# Altium project Light_SPT_Device_v1.1.PrjPcb (part 2 of 4)

## Sheet Controller_Sheet.SchDoc
size 420 x 297 mm; SheetNumber: 3; SheetTotal: 4
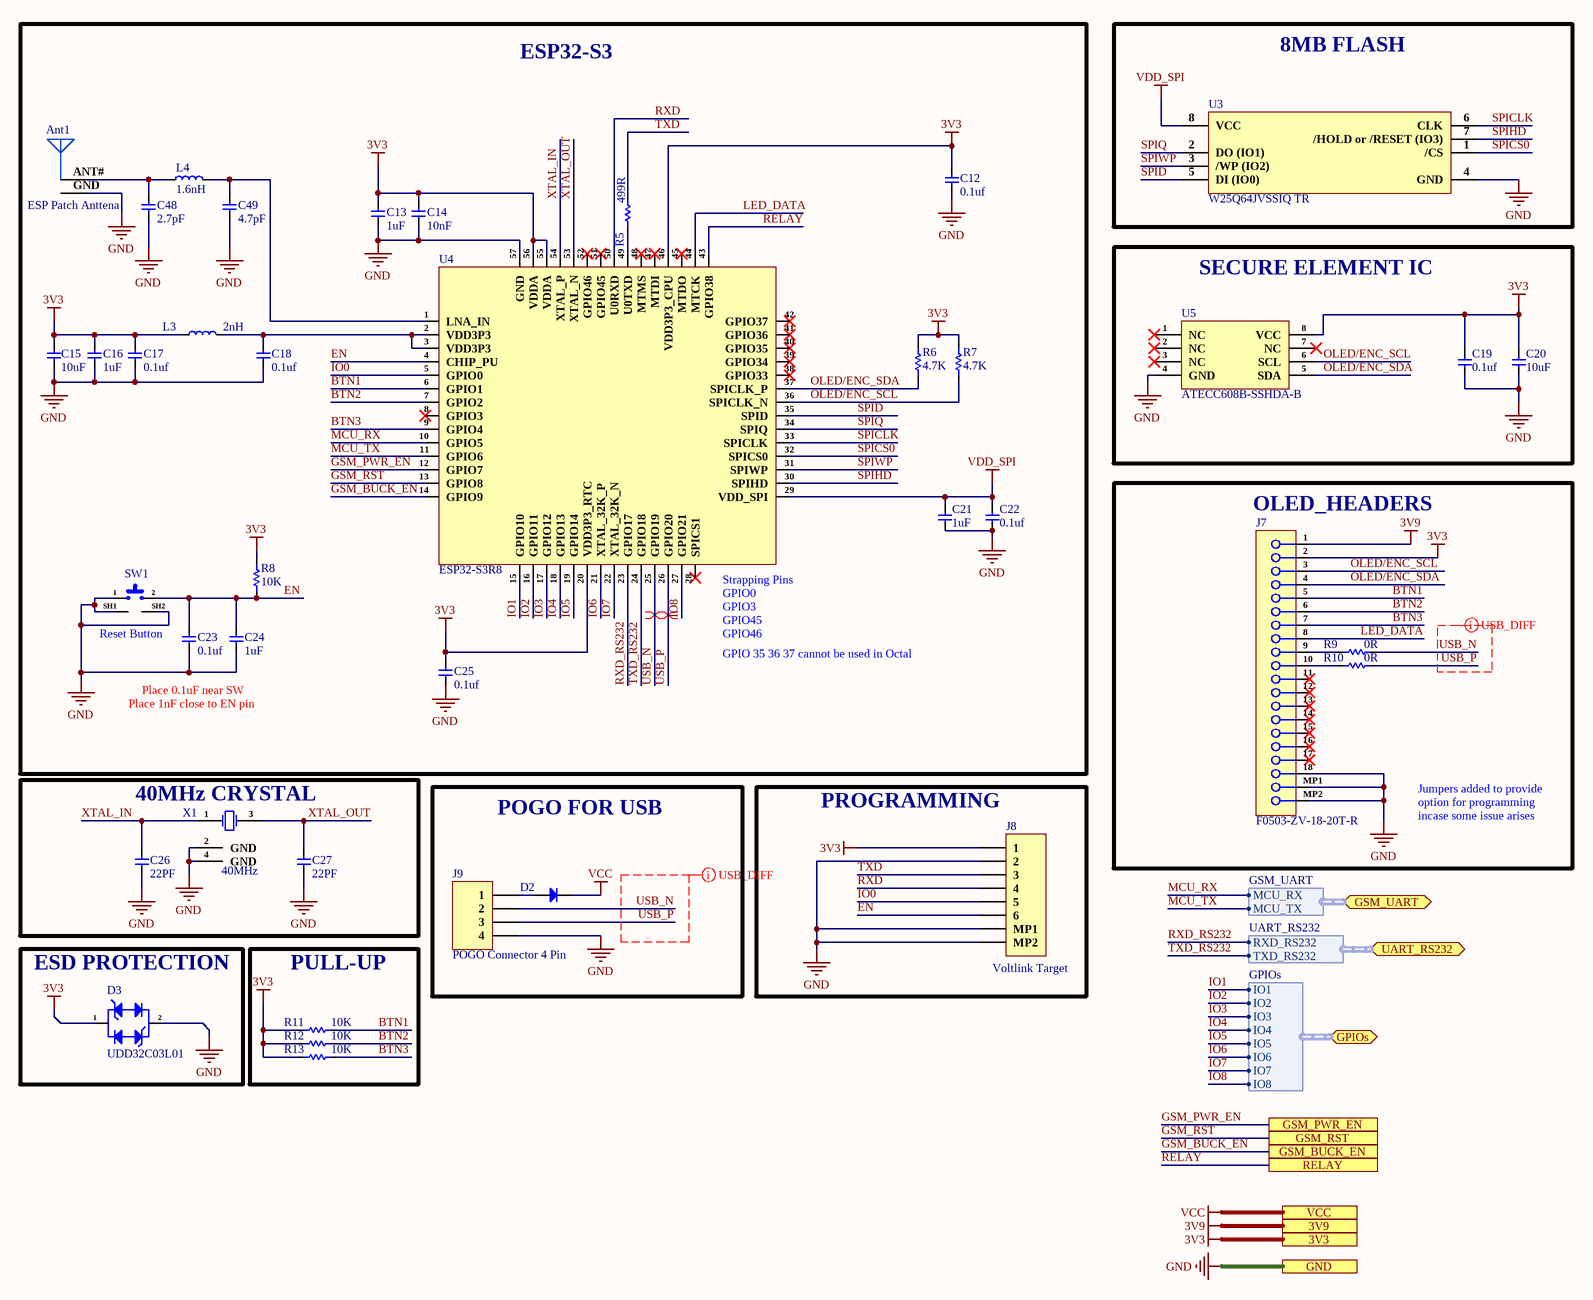
[diagram p2: Controller_Sheet.SchDoc]

### Parts
Ant1  ESP Patch Anttena  [ESP Patch Antenna]  (net tie, no BOM)
C12  0.1uf  [Cap-0402]
C13  1uF  [Cap-0402]
C14  10nF  [Cap-0402]
C15  10uF  [Cap-0402]
C16  1uF  [Cap-0402]
C17  0.1uf  [Cap-0402]
C18  0.1uf  [Cap-0402]
C19  0.1uf  [Cap-0402]
C20  10uF  [Cap-0402]
C21  1uF  [Cap-0402]
C22  0.1uf  [Cap-0402]
C23  0.1uf  [Cap-0402]
C24  1uF  [Cap-0402]
C25  0.1uf  [Cap-0402]
C26  22PF  [Cap-0402]
C27  22PF  [Cap-0402]
C48  2.7pF  [CAP-0201]
C49  4.7pF  [CAP-0201]
D2  1N4148WS-7-F  [SOD-323]  (value not drawn)
D3  UDD32C03L01  [SOD-323]
J7  F0503-ZV-18-20T-R  [F0503-ZV-18-20T-R]
J8  Voltlink Target  [Voltlink Target]
J9  POGO Connector 4 Pin  [Pogo 4 Pin]
L3  2nH  [IND-0603 (1608 Metric)]
L4  1.6nH  [IND-0603 (1608 Metric)]
R5  499R  [Res-0402]
R6  4.7K  [Res-0402]
R7  4.7K  [Res-0402]
R8  10K  [Res-0201]
R9  0R  [Res-0402]
R10  0R  [Res-0402]
R11  10K  [Res-0201]
R12  10K  [Res-0201]
R13  10K  [Res-0201]
SW1  1825027-8  [1825027-8]  (value not drawn)
U3  W25Q64JVSSIQ TR  [SOIC-8 (208 mil)]
U4  ESP32-S3R8  [56-QFN (7x7)]
U5  ATECC608B-SSHDA-B  [SOIC-8]
X1  40MHz  [X322540MPB4SI_]

### Blocks framed on the sheet
ESP32-S3: Ant1 C12-C18 C21-C25 C48 C49 L3 L4 R5-R8 SW1 U4
8MB FLASH: U3
SECURE ELEMENT IC: C19 C20 U5
OLED_HEADERS: J7 R9 R10
40MHz CRYSTAL: C26 C27 X1
POGO FOR USB: D2 J9
PROGRAMMING: J8
ESD PROTECTION: D3
PULL-UP: R11-R13

### Ports
3V3, 3V9, GND, GPIOs (bidir, harness GPIOs), GSM_BUCK_EN, GSM_PWR_EN, GSM_RST, GSM_UART (bidir, harness GSM_UART), RELAY, UART_RS232 (bidir, harness UART_RS232), VCC

### Harnesses
GPIOs: IO1, IO4, IO7, IO2, IO5, IO8, IO3, IO6
GSM_UART: MCU_RX, MCU_TX
UART_RS232: RXD_RS232, TXD_RS232

### Nets
3V3: C12.2 C13.2 C14.2 C15.2 C16.2 C17.2 C19.2 C20.2 C25.2 D3.1 J7.2 J8.1 L3.1 R6.2 R7.2 R8.2 R11.2 R12.2 R13.2 U4.20(VDD3P3_RTC) U4.46(VDD3P3_CPU) U4.55(VDDA) U4.56(VDDA) U5.8(VCC) ; port 3V3
3V9: J7.1 ; port 3V9
GND: Ant1.GND C12.1 C13.1 C14.1 C15.1 C16.1 C17.1 C18.1 C19.1 C20.1 C21.1 C22.1 C23.1 C24.1 C25.1 C26.1 C27.1 C48.1 C49.1 D3.2 J7.18 J7.MP1 J7.MP2 J8.2 J8.MP1 J8.MP2 J9.4 SW1.1 SW1.SH1(GND) SW1.SH2(GND) U3.4(GND) U4.57(GND) U5.4(GND) X1.2(GND) X1.4(GND) ; port GND
VCC: D2.1(K) ; port VCC
VDD_SPI: C21.2 C22.2 U3.8(VCC) U4.29(VDD_SPI)
BTN1: J7.5 R11.1 U4.6(GPIO1)
BTN2: J7.6 R12.1 U4.7(GPIO2)
BTN3: J7.7 R13.1 U4.9(GPIO4)
EN: C23.2 C24.2 J8.6 R8.1 SW1.2 U4.4(CHIP_PU)
GSM_BUCK_EN: U4.14(GPIO9) ; port GSM_BUCK_EN
GSM_PWR_EN: U4.12(GPIO7) ; port GSM_PWR_EN
GSM_RST: U4.13(GPIO8) ; port GSM_RST
IO0: J8.5 U4.5(GPIO0)
IO1: U4.15(GPIO10) ; port GPIOs.IO1
IO2: U4.16(GPIO11) ; port GPIOs.IO2
IO3: U4.17(GPIO12) ; port GPIOs.IO3
IO4: U4.18(GPIO13) ; port GPIOs.IO4
IO5: U4.19(GPIO14) ; port GPIOs.IO5
IO6: U4.21(XTAL_32K_P) ; port GPIOs.IO6
IO7: U4.22(XTAL_32K_N) ; port GPIOs.IO7
IO8: U4.27(GPIO21) ; port GPIOs.IO8
LED_DATA: J7.8 U4.44(MTCK)
MCU_RX: U4.10(GPIO5) ; port GSM_UART.MCU_RX
MCU_TX: U4.11(GPIO6) ; port GSM_UART.MCU_TX
OLED/ENC_SCL: J7.3 R7.1 U4.36(SPICLK_N) U5.6(SCL)
OLED/ENC_SDA: J7.4 R6.1 U4.37(SPICLK_P) U5.5(SDA)
RELAY: U4.43(GPIO38) ; port RELAY
RXD: J8.4 U4.50(U0RXD)
RXD_RS232: U4.23(GPIO17) ; port UART_RS232.RXD_RS232
SPICLK: U3.6(CLK) U4.33(SPICLK)
SPICS0: U3.1(/CS) U4.32(SPICS0)
SPID: U3.5(DI_(IO0)) U4.35(SPID)
SPIHD: U3.7(/HOLD_or_/RESET_(IO3)) U4.30(SPIHD)
SPIQ: U3.2(DO_(IO1)) U4.34(SPIQ)
SPIWP: U3.3(/WP_(IO2)) U4.31(SPIWP)
TXD: J8.3 R5.2
TXD_RS232: U4.24(GPIO18) ; port UART_RS232.TXD_RS232
USB_N: J9.2 R9.2 U4.25(GPIO19)
USB_P: J9.3 R10.2 U4.26(GPIO20)
XTAL_IN: C26.2 U4.54(XTAL_P) X1.1(CRYSTAL)
XTAL_OUT: C27.2 U4.53(XTAL_N) X1.3(CRYSTAL)
NetAnt1_ANT#: Ant1.ANT# C48.2 L4.1
NetC18_2: C18.2 L3.2 U4.2(VDD3P3) U4.3(VDD3P3)
NetC49_2: C49.2 L4.2 U4.1(LNA_IN)
NetD2_2: D2.2(A) J9.1
NetJ7_9: J7.9 R9.1
NetJ7_10: J7.10 R10.1
NetR5_1: R5.1 U4.49(U0TXD)

Not connected (* = marked no-connect by the designer): J7 11* 12* 13* 14* 15* 16* 17*; U4 8(GPIO3)* 28(SPICS1)* 38(GPIO33)* 39(GPIO34)* 40(GPIO35)* 41(GPIO36)* 42(GPIO37)* 45(MTDO)* 47(MTDI)* 48(MTMS)* 51(GPIO45)* 52(GPIO46)*; U5 1(NC)* 2(NC)* 3(NC)* 7(NC)*

### Layout directives
differential pair; net class USB_DIFF; differential pair class USB_DIFF_Lines; rule Matched Net Lengths [Tolerance = 20mil]; rule Impedance Constraint [Min = 85.00    Max = 95.00    ]: USB_N, USB_P
differential pair: USB_N, USB_P

### Notes on the sheet
- Reset Button
- (near U4) Strapping Pins
  GPIO0
  GPIO3
  GPIO45
  GPIO46
- GPIO 35 36 37 cannot be used in Octal PSRAM
- Place 1nF close to EN pin
- Place 0.1uF near SW
- Jumpers added to provide option for programming incase some issue arises
- File:
- Title:
- Date:
- Page
- Num:
- Total:
- Drawn By: Huzaifa Ali

### Library data of the parts
Ant1 = ESP Patch Anttena: ESP32 MIFA PCB ANTENNA; Item Type: Antenna; Manufacturer Part Number: ESP Patch Anttena
C12 C17-C19 C22 C23 C25 = GRM155R62A104KE14D: CAP CER 0.1UF 100V X5R 0402; Manufacturer: Murata; Capacitance: 100nF; Tolerance: 10%; Item Type: Capacitor; Supplier 1: Arrow Electronics; Manufacturer Part Number: GRM155R62A104KE14D; RoHS: Yes; Category: Ceramic Capacitors; Stock 1: 870000; Pricing 1: 10000=0.00500, 20000=0.00410, 30000=0.00390, 50000=0.00370, 100000=0.00300 (USD); Mount: Surface Mount; Case/Package: 0402; Case Code (Metric): 1005; Case Code (Imperial): 0402; Weight: 0.000212oz; Min Operating Temperature: -55°C; Max Operating Temperature: 85°C; Packaging: Tape and Reel; Voltage Rating: 100V; Dielectric: X5R; Termination: SMD/SMT; Voltage Rating (DC): 100V; Package Quantity: 10000; Series: GRM; Length: 0.039inch; Width: 0.02inch; Height: 0.5mm; Thickness: 0.022inch; Reach SVHC Compliant: Yes; Lead Free: Lead Free; RoHS Compliant: Yes; ComponentLink1URL: http://www.farnell.com/datasheets/2079151.pdf?src-supplier=Farnell; ComponentLink1Description: http://www.farnell.com/datasheets/2079151.pdf?src-supplier=Farnell; ComponentLink2URL: http://www.mouser.com/ds/2/281/c02e-2905.pdf?src-supplier=Mouser; ComponentLink2Description: http://www.mouser.com/ds/2/281/c02e-2905.pdf?src-supplier=Mouser; ComponentLink3URL: http://www.farnell.com/datasheets/2079151.pdf?src-supplier=Element14; ComponentLink3Description: http://www.farnell.com/datasheets/2079151.pdf?src-supplier=Element14; ComponentLink4URL: http://search.murata.co.jp/Ceramy/image/img/A01X/G101/ENG/GRM155R62A104KE14-01.pdf?src-supplier=Digi-Key; ComponentLink4Description: http://search.murata.co.jp/Ceramy/image/img/A01X/G101/ENG/GRM155R62A104KE14-01.pdf?src-supplier=Digi-Key; ComponentLink5URL: http://www.farnell.com/datasheets/2079151.pdf?src-supplier=Newark; ComponentLink5Description: http://www.farnell.com/datasheets/2079151.pdf?src-supplier=Newark; Supplier Part Number 1: GRM155R62A104KE14D; LCSC Part Number: C162178
C13 C16 C21 C24 = UMK105CBJ105MV-F: CAP CER 1UF 50V X5R 0402; Manufacturer: Taiyo Yuden; Item Type: Capacitor; Supplier 1: Digi-Key; Manufacturer Part Number: UMK105CBJ105MV-F; Stock 1: 412061; Pricing 1: 1=0.27, 10=0.184, 50=0.1224, 100=0.104, 500=0.07342, 1000=0.06424, 2500=0.06118, 5000=0.05659 (USD); Lead Free: Lead Free; RoHS Compliant: Yes; ComponentLink1URL: http://www.farnell.com/datasheets/2801300.pdf?src-supplier=Newark; ComponentLink1Description: http://www.farnell.com/datasheets/2801300.pdf?src-supplier=Newark; ComponentLink2URL: http://www.farnell.com/datasheets/2801300.pdf?src-supplier=Farnell; ComponentLink2Description: http://www.farnell.com/datasheets/2801300.pdf?src-supplier=Farnell; ComponentLink3URL: https://ds.yuden.co.jp/TYCOMPAS/ut/detail?pn=UMK105CBJ105MV-F &amp;u=M&src-supplier=Digi-Key; ComponentLink3Description: https://ds.yuden.co.jp/TYCOMPAS/ut/detail?pn=UMK105CBJ105MV-F &amp;u=M&src-supplier=Digi-Key; Supplier Part Number 1: 587-6278-1-ND; LCSC Part Number: C2880413
C14 = CC0402KRX7R9BB103: CAP CER 10000PF 50V X7R 0402; Manufacturer: Yageo; Tolerance: 10%; Item Type: Capacitor; Supplier 1: Avnet; Manufacturer Part Number: CC0402KRX7R9BB103; RoHS: Yes; Category: Ceramic Capacitors; Stock 1: 995000; Pricing 1: 10000=0.00178 (USD); Mount: Surface Mount; Case/Package: 0402; Case Code (Imperial): 0402; Case Code (Metric): 1005; Min Operating Temperature: -55°C; Max Operating Temperature: 125°C; Capacitance: 10nF; Dielectric: X7R; Packaging: Tape and Reel; Voltage Rating: 50V; Voltage Rating (DC): 50V; Package Quantity: 1; Termination: SMD/SMT; Resistor Type: Ceramic; Voltage: 50V; Series: CC; Length: 1mm; Width: 0.02inch; Height: 0.5mm; Thickness: 0.022inch; Depth: 0.5mm; Radiation Hardening: No; RoHS Compliant: Yes; Reach SVHC Compliant: Yes; Lead Free: Lead Free; Halogen Free: Halogen Free; ComponentLink1URL: https://datasheet.ciiva.com/11788/0900766b8079c870-11788375.pdf?src-supplier=RSComponents; ComponentLink1Description: https://datasheet.ciiva.com/11788/0900766b8079c870-11788375.pdf?src-supplier=RSComponents; ComponentLink2URL: https://datasheet.ciiva.com/26862/getdatasheetpartid-138248-26862642.pdf?src-supplier=Verical; ComponentLink2Description: https://datasheet.ciiva.com/26862/getdatasheetpartid-138248-26862642.pdf?src-supplier=Verical; ComponentLink3URL: https://datasheet.ciiva.com/7978/1489800-7978093.pdf?src-supplier=Element14; ComponentLink3Description: https://datasheet.ciiva.com/7978/1489800-7978093.pdf?src-supplier=Element14; ComponentLink4URL: https://datasheet.ciiva.com/28450/1489800-28450377.pdf?src-supplier=Element14; ComponentLink4Description: https://datasheet.ciiva.com/28450/1489800-28450377.pdf?src-supplier=Element14; ComponentLink5URL: https://datasheet.ciiva.com/176/mlccorderingcode-176349.pdf?src-supplier=Digi-Key; ComponentLink5Description: https://datasheet.ciiva.com/176/mlccorderingcode-176349.pdf?src-supplier=Digi-Key; ComponentLink6URL: https://datasheet.ciiva.com/176/mlccorderingcode-176348.pdf?src-supplier=Digi-Key; ComponentLink6Description: https://datasheet.ciiva.com/176/mlccorderingcode-176348.pdf?src-supplier=Digi-Key; ComponentLink7URL: https://datasheet.ciiva.com/176/mlccorderingcode-176350.pdf?src-supplier=Digi-Key; ComponentLink7Description: https://datasheet.ciiva.com/176/mlccorderingcode-176350.pdf?src-supplier=Digi-Key; Supplier Part Number 1: CC0402KRX7R9BB103; LCSC Part Number: C60133
C15 C20 = CL05A106MP5NUNC: CAP CER 10UF 10V X5R 0402; Manufacturer: Samsung; Tolerance: 20%; Item Type: Capacitor; Supplier 1: Avnet; Manufacturer Part Number: CL05A106MP5NUNC; RoHS: Yes; Category: Ceramic Capacitors; Stock 1: 1729850; Pricing 1: 10000=0.02537 (USD); Mount: Surface Mount; Case/Package: 0402; Case Code (Metric): 1005; Case Code (Imperial): 0402; Contact Plating: Tin; Min Operating Temperature: -55°C; Max Operating Temperature: 85°C; Package Quantity: 1; Packaging: Tape and Reel; Capacitance: 10uF; Voltage Rating: 10V; Dielectric: X5R; Termination: Wraparound; Series: CL; Construction: Flat; Length: 1mm; Width: 0.02inch; Thickness: 0.028inch; Depth: 0.5mm; Radiation Hardening: No; Lead Free: Lead Free; RoHS Compliant: Yes; ComponentLink1URL: https://datasheet.ciiva.com/25721/cl05a106mp5nunc-25721584.pdf?src-supplier=Digi-Key; ComponentLink1Description: https://datasheet.ciiva.com/25721/cl05a106mp5nunc-25721584.pdf?src-supplier=Digi-Key; ComponentLink2URL: https://datasheet.ciiva.com/26838/getdatasheetpartid-745310-26838170.pdf?src-supplier=Verical; ComponentLink2Description: https://datasheet.ciiva.com/26838/getdatasheetpartid-745310-26838170.pdf?src-supplier=Verical; Supplier Part Number 1: CL05A106MP5NUNC; LCSC Part Number: C315248
C26 C27 = CC0402JRNPO9BN220: CAP CER 22PF 50V C0G/NPO 0402; Manufacturer: Yageo; Dielectric Material: Ceramic; Tolerance: 5%; Dielectric: C0G; Temperature Coefficient: 30ppm/°C; Insulation Resistance: 100GR; Item Type: Capacitor; Supplier 1: Future Electronics; Manufacturer Part Number: CC0402JRNPO9BN220; RoHS: Yes; Category: Ceramic Capacitors; Stock 1: 200000; Pricing 1: 10000=0.00220, 40000=0.00210, 150000=0.00200, 400000=0.00190, 1000000=0.00180 (USD); Mounting Technology: Surface Mount; Case/Package: 0402; Pins: 2; Case Code (Metric): 1005; Case Code (Imperial): 0402; Min Operating Temperature: -55°C; Max Operating Temperature: 125°C; Value: 22pF; Voltage Rating: 50V; Packaging: Tape and Reel; Package Quantity: 1; Voltage Rating (DC): 50V; Termination: SMD/SMT; Resistor Type: Ceramic; Voltage: 50V; Series: CC; Length: 1mm; Width: 0.02inch; Height: 0.5mm; Thickness: 0.022inch; Depth: 0.5mm; Radiation Hardening: No; Reach SVHC Compliant: Yes; Lead Free: Lead Free; RoHS Compliant: Yes; ComponentLink1URL: https://datasheet.ciiva.com/5789/1443161-5789509.pdf?src-supplier=Farnell; ComponentLink1Description: https://datasheet.ciiva.com/5789/1443161-5789509.pdf?src-supplier=Farnell; ComponentLink2URL: https://datasheet.ciiva.com/8033/1443161-8033606.pdf?src-supplier=Element14; ComponentLink2Description: https://datasheet.ciiva.com/8033/1443161-8033606.pdf?src-supplier=Element14; ComponentLink3URL: https://datasheet.ciiva.com/7656/1132289-7656615.pdf?src-supplier=Element14; ComponentLink3Description: https://datasheet.ciiva.com/7656/1132289-7656615.pdf?src-supplier=Element14; ComponentLink4URL: https://datasheet.ciiva.com/8033/1443161-8033607.pdf?src-supplier=Element14; ComponentLink4Description: https://datasheet.ciiva.com/8033/1443161-8033607.pdf?src-supplier=Element14; ComponentLink5URL: https://datasheet.ciiva.com/8033/1443161-8033605.pdf?src-supplier=Element14; ComponentLink5Description: https://datasheet.ciiva.com/8033/1443161-8033605.pdf?src-supplier=Element14; ComponentLink6URL: https://datasheet.ciiva.com/143/mlccorderingcode-143987.pdf?src-supplier=Digi-Key; ComponentLink6Description: https://datasheet.ciiva.com/143/mlccorderingcode-143987.pdf?src-supplier=Digi-Key; ComponentLink7URL: https://datasheet.ciiva.com/143/mlccorderingcode-143986.pdf?src-supplier=Digi-Key; ComponentLink7Description: https://datasheet.ciiva.com/143/mlccorderingcode-143986.pdf?src-supplier=Digi-Key; ComponentLink8URL: https://datasheet.ciiva.com/143/mlccorderingcode-143988.pdf?src-supplier=Digi-Key; ComponentLink8Description: https://datasheet.ciiva.com/143/mlccorderingcode-143988.pdf?src-supplier=Digi-Key; ComponentLink9URL: https://datasheet.ciiva.com/5425/upy-gp-np0-16v-to-50v-8-5425483.pdf?src-supplier=Mouser; ComponentLink9Description: https://datasheet.ciiva.com/5425/upy-gp-np0-16v-to-50v-8-5425483.pdf?src-supplier=Mouser; ComponentLink10URL: https://datasheet.ciiva.com/15189/getdatasheetpartid-370074-15189117.pdf?src-supplier=Verical; ComponentLink10Description: https://datasheet.ciiva.com/15189/getdatasheetpartid-370074-15189117.pdf?src-supplier=Verical; Supplier Part Number 1: 9105957; LCSC Part Number: C106203
C48 = CC0201CRNPO9BN2R7: CAP CER 2.7PF 50V C0G/NPO 0201; Manufacturer: Yageo; Dielectric: C0G; Item Type: Capacitor; Supplier: Avnet; Supplier Part Number: CC0201CRNPO9BN2R7; Manufacturer Part Number: CC0201CRNPO9BN2R7; RoHS: Yes; Category: Ceramic Capacitors; Stock: 15000; Pricing: 15000=0.0017 (USD); Mounting Technology: Surface Mount; Case/Package: 0201; Case Code (Imperial): 0201; Case Code (Metric): 0603; Weight: 6E-06oz; Min Operating Temperature: -55°C; Max Operating Temperature: 125°C; Value: 2.7pF; Packaging: Tape and Reel; Voltage Rating (DC): 50V; Voltage Rating: 50V; Termination: SMD/SMT; Series: CC; Length: 0.024inch; Width: 0.012inch; Thickness: 0.013inch; RoHS Compliant: Yes; ComponentLink1URL: https://datasheet.ciiva.com/13208/upy-gp-np0-16v-to-50v-8-13208314.pdf?src-supplier=Mouser; ComponentLink1Description: https://datasheet.ciiva.com/13208/upy-gp-np0-16v-to-50v-8-13208314.pdf?src-supplier=Mouser; LCSC Part Number: C325439
C49 = CC0201BRNPO9BN4R7: CAP CER 4.7PF 50V C0G/NPO 0201; Manufacturer: Yageo; Item Type: Capacitor; Supplier: Arrow Electronics; Supplier Part Number: CC0201BRNPO9BN4R7; Manufacturer Part Number: CC0201BRNPO9BN4R7; RoHS: Yes; Category: Ceramic Capacitors; Stock: 210000; Pricing: 15000=0.0023 (USD); Mounting Technology: Surface Mount; Case/Package: 0201; Min Operating Temperature: -55°C; Max Operating Temperature: 125°C; Packaging: Tape and Reel; Value: 4.7pF; Voltage Rating: 50V; Series: CC; Length: 0.024inch; Width: 0.012inch; Thickness: 0.013inch; RoHS Compliant: Yes; ComponentLink1URL: https://www.yageo.com/upload/media/product/productsearch/datasheet/mlcc/UPY-GP_NP0_16V-to-50V_18.pdf?src-supplier=Digi-Key; ComponentLink1Description: https://www.yageo.com/upload/media/product/productsearch/datasheet/mlcc/UPY-GP_NP0_16V-to-50V_18.pdf?src-supplier=Digi-Key; ComponentLink2URL: http://www.yageo.com/documents/recent/UPY-GP_NP0_16V-to-50V_16.pdf?src-supplier=Digi-Key; ComponentLink2Description: http://www.yageo.com/documents/recent/UPY-GP_NP0_16V-to-50V_16.pdf?src-supplier=Digi-Key; LCSC Part Number: C505471
D2 = 1N4148WS-7-F: DIODE GEN PURP 75V 150MA SOD323; Manufacturer: Diodes; Forward Current: 300mA; Reverse Recovery Time: 4ns; Element Configuration: Single; Forward Voltage: 1.25V; Max Reverse Current: 1uA; Peak Non-Repetitive Surge Current: 2A; Power Dissipation: 200mW; Polarity: Standard; Capacitance: 2pF; Supplier 1: Mouser; Manufacturer Part Number: 1N4148WS-7-F; RoHS: Yes; Category: Rectifier Diodes; Pricing 1: 1=0.19000, 10=0.17500, 50=0.17500, 100=0.09600, 500=0.05900, 1000=0.04000, 3000=0.03000, 9000=0.02600, 10000=0.02600, 24000=0.02300, 45000=0.01900 (USD); Mount: Surface Mount; Number of Pins: 2; Weight: 0.000173oz; Contact Plating: Tin,Matte; Min Operating Temperature: -65°C; Max Operating Temperature: 150°C; Max Repetitive Reverse Voltage (Vrrm): 75V; Max Forward Surge Current (Ifsm): 2A; Max Surge Current: 2A; Packaging: Tape and Reel; Recovery Time: 4ns; Package Quantity: 3000; Average Rectified Current: 150mA; Voltage Rating (DC): 75V; Power Rating: 200mW; Current Rating: 150mA; Output Current: 150mA; Voltage: 75V; Max Reverse Voltage (DC): 75V; Series: -; Reverse Recovery Time-Max: 4ns; Length: 1.8mm; Width: 1.4mm; Height: 1mm; Radiation Hardening: No; REACH SVHC: No SVHC; Lead Free: Lead Free; RoHS Compliant: Yes; ComponentLink1URL: https://datasheet.ciiva.com/1179/ds30097-1179355.pdf?src-supplier=Element14; ComponentLink1Description: https://datasheet.ciiva.com/1179/ds30097-1179355.pdf?src-supplier=Element14; ComponentLink2URL: https://datasheet.ciiva.com/8300/ds30097-8300396.pdf?src-supplier=Avnet; ComponentLink2Description: https://datasheet.ciiva.com/8300/ds30097-8300396.pdf?src-supplier=Avnet; ComponentLink3URL: https://datasheet.ciiva.com/16199/ds30097-16199061.pdf?src-supplier=Future+Electronics; ComponentLink3Description: https://datasheet.ciiva.com/16199/ds30097-16199061.pdf?src-supplier=Future+Electronics; ComponentLink4URL: https://datasheet.ciiva.com/911/ds30097-911742.pdf?src-supplier=Digi-Key; ComponentLink4Description: https://datasheet.ciiva.com/911/ds30097-911742.pdf?src-supplier=Digi-Key; ComponentLink5URL: https://datasheet.ciiva.com/911/ds30097-911743.pdf?src-supplier=Digi-Key; ComponentLink5Description: https://datasheet.ciiva.com/911/ds30097-911743.pdf?src-supplier=Digi-Key; ComponentLink6URL: https://datasheet.ciiva.com/911/ds30097-911741.pdf?src-supplier=Digi-Key; ComponentLink6Description: https://datasheet.ciiva.com/911/ds30097-911741.pdf?src-supplier=Digi-Key; Supplier Part Number 1: 621-1N4148WS-F; LCSC Part Number: C60580; Item Type: Diode
D3 = UDD32C03L01: 15V 19A 3.3V 4V Bidirectional SOD-323 ESD Protection Devices ROHS; Manufacturer: Brightking; Item Type: ESD Diode; Manufacturer Part Number: UDD32C03L01; ComponentLink1Description: LCSC; ComponentLink1URL: https://lcsc.com/product-detail/span-style-background-color-ff0-ESD-span-Protection-Devices_Brightking-Elec-TAIWAN-UDD32C03L01_C78439.html; LCSC Part Number: C78439
J7 = F0503-ZV-18-20T-R: Slide Lock 18P Contact, Vertical - One Side Brick nogging 0.5mm SMD,P=0.5mm FFC/FPC Connectors ROHS; Manufacturer: XFCN; Manufacturer Part Number: F0503-ZV-18-20T-R; Package: SMD,P=0.5mm; LCSC Part Number: C481243; Item Type: FPC Connector; ComponentLink1Description: LCSC; ComponentLink1URL: https://www.lcsc.com/product-detail/FFC-FPC-Connectors_XFCN-F0503-ZV-18-20T-R_C481243.html
J8 = C145963: 1x6P SH 1 1mm 6 SMD,P=1mm Wire To Board / Wire To Wire Connector ROHS; Manufacturer: BOOMELE; Manufacturer Part Number: C145963; Package: SMD,P=1mm; LCSC Part Number: C145963; Item Type: Connector; ComponentLink1Description: LCSC; ComponentLink1URL: https://www.lcsc.com/product-detail/Wire-To-Board-Wire-To-Wire-Connector_BOOMELE-Boom-Precision-Elec-C145963_C145963.html
J9 = POGO Connector 4 Pin: Pogo Pad 2.5mm 4 Pin; Item Type: Pogo Connector; Manufacturer Part Number: POGO Connector 4 Pin
L3 = SDCL1608C2N0STDF: 2nH ±0.3nH 0603 Inductors; Manufacturer: Sunlord; Manufacturer Part Number: SDCL1608C2N0STDF; Footprint: 0603; ComponentLink1Description: LCSC; ComponentLink1URL: https://lcsc.com/product-detail/Inductors-SMD_Sunlord-SDCL1608C2N0STDF_C370234.html; Value: 2nH; LCSC Part Number: C370234
L4 = FHW0603UC1N6KST: 700mA 1.6nH ±10% 40mΩ 0603 Inductors (SMD) ROHS; Manufacturer: FH; Footprint: 0603; Manufacturer Part Number: FHW0603UC1N6KST; Value: 1.6nH; LCSC Part Number: C317978; ComponentLink1Description: LCSC; ComponentLink1URL: https://www.lcsc.com/product-detail/Inductors-SMD_FH-Guangdong-Fenghua-Advanced-Tech-FHW0603UC1N6KST_C317978.html
R5 = RC0402FR-07499RL: RES 499 OHM 1% 1/16W 0402; Manufacturer: Yageo; Power Rating: 62.5mW; Voltage Rating: 50V; Max Power Dissipation: 63mW; Temperature Coefficient: 100ppm/°C; Supplier 1: Mouser; Manufacturer Part Number: RC0402FR-07499RL; RoHS: Yes; Category: Chip SMD Resistors; Stock 1: 936879; Pricing 1: 1=0.10000, 10=0.01200, 50=0.01200, 100=0.00500, 1000=0.00300, 10000=0.00100 (USD); Case/Package: 0402; Case Code (Metric): 1005; Case Code (Imperial): 0402; Size Code: 0402; Min Operating Temperature: -55°C; Max Operating Temperature: 155°C; Resistance: 499R; Tolerance: 1%; Package Quantity: 1; Packaging: Tape and Reel; Resistor Type: Thick Film; Number of Terminations: 2; Termination: SMD/SMT; Voltage Rating (DC): 50V; Features: Moisture Resistant; Series: RC; Resistance Tolerance: 1%; Construction: Rectangular; Length: 1mm; Width: 0.02inch; Height: 0.016inch; Depth: 0.5mm; RoHS Compliant: Yes; REACH SVHC: No SVHC; Military Standard: Not; Lead Free: Lead Free; ComponentLink1URL: https://datasheet.ciiva.com/2453/pyu-r-int-thick-7-2453539.pdf?src-supplier=Digi-Key; ComponentLink1Description: https://datasheet.ciiva.com/2453/pyu-r-int-thick-7-2453539.pdf?src-supplier=Digi-Key; ComponentLink2URL: https://datasheet.ciiva.com/2453/pyu-r-int-thick-7-2453540.pdf?src-supplier=Digi-Key; ComponentLink2Description: https://datasheet.ciiva.com/2453/pyu-r-int-thick-7-2453540.pdf?src-supplier=Digi-Key; ComponentLink3URL: https://datasheet.ciiva.com/2453/pyu-r-int-thick-7-2453538.pdf?src-supplier=Digi-Key; ComponentLink3Description: https://datasheet.ciiva.com/2453/pyu-r-int-thick-7-2453538.pdf?src-supplier=Digi-Key; Supplier Part Number 1: 603-RC0402FR-07499RL; LCSC Part Number: C137970
R6 R7 = RC0402FR-074K7L: RES 4.7K OHM 1% 1/16W 0402; Manufacturer: Yageo; Voltage Rating (DC): 50V; Power Rating: 62.5mW; Resistance: 4.7kR; Temperature Coefficient: 100ppm/°C; Max Power Dissipation: 63mW; Item Type: Resistor; Supplier 1: Avnet; Manufacturer Part Number: RC0402FR-074K7L; RoHS: Yes; Category: Chip SMD Resistors; Stock 1: 2420000; Pricing 1: 10000=0.00085 (USD); Case/Package: 0402; Number of Pins: 2; Case Code (Imperial): 0402; Case Code (Metric): 1005; Size Code: 0402; Min Operating Temperature: -55°C; Max Operating Temperature: 155°C; Tolerance: 1%; Voltage Rating: 50V; Packaging: Tape and Reel; Resistor Type: Thick Film; Termination: SMD/SMT; Features: Moisture Resistant; Series: RC; Number of Terminations: 2; Resistance Tolerance: 1%; Construction: Rectangular; Length: 1mm; Width: 0.5mm; Height: 0.32mm; Depth: 0.5mm; Height - Seated (Max): 0.016inch; RoHS Compliant: Yes; Reach SVHC Compliant: Yes; Military Standard: Not; Lead Free: Lead Free; ComponentLink1URL: https://datasheet.ciiva.com/22661/1686128-22661342.pdf?src-supplier=Element14; ComponentLink1Description: https://datasheet.ciiva.com/22661/1686128-22661342.pdf?src-supplier=Element14; ComponentLink2URL: https://datasheet.ciiva.com/7850/1018594-7850022.pdf?src-supplier=Element14; ComponentLink2Description: https://datasheet.ciiva.com/7850/1018594-7850022.pdf?src-supplier=Element14; ComponentLink3URL: https://datasheet.ciiva.com/7850/1018594-7850023.pdf?src-supplier=Element14; ComponentLink3Description: https://datasheet.ciiva.com/7850/1018594-7850023.pdf?src-supplier=Element14; ComponentLink4URL: https://datasheet.ciiva.com/15215/getdatasheetpartid-328119-15215035.pdf?src-supplier=Verical; ComponentLink4Description: https://datasheet.ciiva.com/15215/getdatasheetpartid-328119-15215035.pdf?src-supplier=Verical; Supplier Part Number 1: RC0402FR-074K7L; LCSC Part Number: C105871
R8 R11-R13 = RC0201FR-0710KL: RES SMD 10K OHM 1% 1/20W 0201; Manufacturer: Yageo; Item Type: Resistor; Manufacturer Part Number: RC0201FR-0710KL; Package: 0201; ComponentLink7Description: LCSC; ComponentLink7URL: https://www.lcsc.com/product-detail/Chip-Resistor-Surface-Mount_YAGEO-RC0201FR-0710KL_C106225.html; LCSC Part Number: C106225
R9 R10 = RC0402FR-070RL: RES 0 OHM JUMPER 1/16W 0402; Manufacturer: Yageo; Tolerance: 1%; Power Rating: 62.5mW; Voltage Rating: 50V; Temperature Coefficient: 200ppm/°C; Max Power Dissipation: 63mW; Supplier 1: Mouser; Manufacturer Part Number: RC0402FR-070RL; RoHS: Yes; Category: Chip SMD Resistors; Stock 1: 8556842; Pricing 1: 1=0.10000, 10=0.01400, 50=0.01400, 100=0.00600, 1000=0.00300, 5000=0.00200, 10000=0.00100 (USD); Mount: Surface Mount; Case/Package: 0402; Contact Plating: Tin,Matte; Case Code (Imperial): 0402; Case Code (Metric): 1005; Size Code: 0402; Min Operating Temperature: -55°C; Max Operating Temperature: 155°C; Resistance: 0R; Resistor Type: Thick Film; Packaging: Tape and Reel; Termination: SMD/SMT; Features: Moisture Resistant; Series: RC; Number of Terminations: 2; Length: 1mm; Width: 0.5mm; Height: 0.35mm; Radiation Hardening: No; Lead Free: Lead Free; RoHS Compliant: Yes; ComponentLink1URL: https://datasheet.ciiva.com/8896/pyu-rc0402-51-rohs-l-6-8896149.pdf?src-supplier=Avnet; ComponentLink1Description: https://datasheet.ciiva.com/8896/pyu-rc0402-51-rohs-l-6-8896149.pdf?src-supplier=Avnet; ComponentLink2URL: https://datasheet.ciiva.com/16790/pyu-rc0402-51-rohs-l-6-r-16790444.pdf?src-supplier=Future+Electronics; ComponentLink2Description: https://datasheet.ciiva.com/16790/pyu-rc0402-51-rohs-l-6-r-16790444.pdf?src-supplier=Future+Electronics; Supplier Part Number 1: 603-RC0402FR-070RL; LCSC Part Number: C106231
SW1 = 1825027-8: 50mA Lying SPST 24V Plugin Tactile Switches ROHS; Manufacturer: TE Connectivity; Supplier 1: Arrow Electronics; Manufacturer Part Number: 1825027-8; RoHS: Yes; Category: Pushbutton Switches; Stock 1: 178529; Pricing 1: 1=0.13800, 10=0.13370, 25=0.12590, 100=0.10940, 250=0.10570, 500=0.09520, 1000=0.07320, 2500=0.07250, 5000=0.06250 (USD); ComponentLink1URL: https://datasheet.ciiva.com/30072/eng-cd-1825027-f-30072833.pdf?src-supplier=Onlinecomponents.com; ComponentLink1Description: https://datasheet.ciiva.com/30072/eng-cd-1825027-f-30072833.pdf?src-supplier=Onlinecomponents.com; ComponentLink2URL: https://datasheet.ciiva.com/16393/1825027-8-16393346.pdf?src-supplier=Future+Electronics; ComponentLink2Description: https://datasheet.ciiva.com/16393/1825027-8-16393346.pdf?src-supplier=Future+Electronics; ComponentLink3URL: https://datasheet.ciiva.com/8164/eng-cd-1825027-g4-8164921.pdf?src-supplier=Avnet; ComponentLink3Description: https://datasheet.ciiva.com/8164/eng-cd-1825027-g4-8164921.pdf?src-supplier=Avnet; Supplier Part Number 1: 1825027-8; Item Type: Tactile Switch
U3 = W25Q64JVSSIQ TR: IC FLASH 64M SPI 133MHZ 8SOIC; Manufacturer: Winbond; Memory Format: FLASH,NOR; Interface: SPI,Serial; Supplier 1: Arrow Electronics; Manufacturer Part Number: W25Q64JVSSIQ TR; RoHS: Yes; Category: Memory; Stock 1: 56000; Pricing 1: 2000=0.8199, 4000=0.7715, 6000=0.7637, 10000=0.7635 (USD); Case/Package: SOIC; Min Operating Temperature: -40°C; Max Operating Temperature: 85°C; Packaging: Tape and Reel; Series: SpiFlash®; ComponentLink1URL: http://www.winbond.com/resource-files/w25q64jv%20spi%20%20%20revc%2006032016%20kms.pdf?src-supplier=Digi-Key; ComponentLink1Description: http://www.winbond.com/resource-files/w25q64jv%20spi%20%20%20revc%2006032016%20kms.pdf?src-supplier=Digi-Key; ComponentLink2URL: http://www.winbond.com/resource-files/w25q64jv%20revj%2003272018%20plus.pdf?src-supplier=Digi-Key; ComponentLink2Description: http://www.winbond.com/resource-files/w25q64jv%20revj%2003272018%20plus.pdf?src-supplier=Digi-Key; Supplier Part Number 1: W25Q64JVSSIQ TR; LCSC Part Number: C179171; Item Type: IC
U4 = ESP32-S3R8: SMD IC ESP32-S3R8, DUAL-CORE MCU; Manufacturer: Espressif Systems; Supplier 1: Mouser; Manufacturer Part Number: ESP32-S3R8; RoHS: No; Category: RF Receivers, Transceivers; Stock 1: 2366; Pricing 1: 1=2.46, 10=2.46, 50=2.46, 100=2.46, 1000=2.46, 10000=2.46 (USD); Supplier Part Number 1: 356-ESP32-S3R8; Item Type: IC
U5 = ATECC608B-SSHDA-B: IC AUTHENTICATION CHIP 8SOIC; Manufacturer: Microchip; Supplier 1: Rs; Manufacturer Part Number: ATECC608B-SSHDA-B; RoHS: Yes; Category: Interface ICs; Stock 1: 590; Pricing 1: 20=0.758, 50=0.704, 80=0.691 (GBP); Supplier Part Number 1: 2368834P; ComponentLink1Description: LCSC; ComponentLink1URL: https://www.lcsc.com/product-detail/Security-Verification-Encryption-ICs_Microchip-Tech-ATECC608B-SSHDA-B_C5444784.html; LCSC Part Number: C5444784; Item Type: IC
X1 = X322540MPB4SI: 40MHz SMD Crystal Resonator 15pF SMD3225-4P Crystals ROHS; Manufacturer: Yangxing Tech; Manufacturer Part Number: X322540MPB4SI; Value: 40MHZ; LCSC Part Number: C9010; ComponentLink1Description: LCSC; ComponentLink1URL: https://www.lcsc.com/product-detail/Crystals_Yangxing-Tech-X322540MPB4SI_C9010.html; Item Type: Crystal